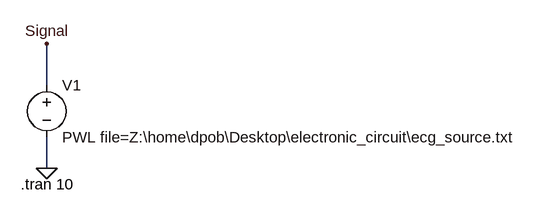
[diagram p0: schematic ecg_real.asc]
ecg_real.asc, the LTspice schematic file:
Version 4.1
SHEET 1 980 680
WIRE 160 128 160 64
WIRE 160 256 160 208
FLAG 160 256 0
FLAG 160 64 Signal
SYMBOL voltage 160 112 R0
WINDOW 123 0 0 Left 0
WINDOW 39 0 0 Left 0
SYMATTR InstName V1
SYMATTR Value PWL file=Z:\home\dpob\Desktop\electronic_circuit\ecg_source.txt
TEXT 120 280 Left 2 !.tran 10

The netlist it stands for:
* ecg_real.asc
V1 Signal 0 PWL file=Z:\home\dpob\Desktop\electronic_circuit\ecg_source.txt
.tran 10
.backanno
.end